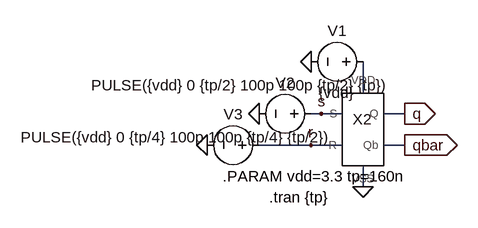
[diagram p0: schematic srlatch_tb_tran.asc]
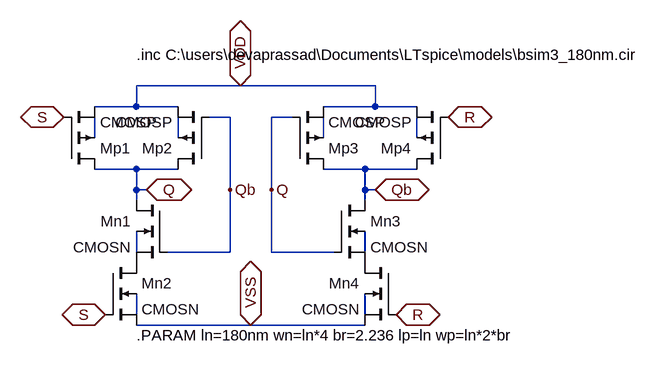
[diagram p1: sub-circuit srlatch.asc]
srlatch_tb_tran.asc, the LTspice schematic file:
Version 4.1
SHEET 1 880 680
WIRE 192 96 192 48
WIRE 128 128 112 128
WIRE 160 128 128 128
WIRE 256 128 224 128
WIRE 112 176 32 176
WIRE 160 176 112 176
WIRE 256 176 224 176
WIRE 192 240 192 208
FLAG 192 240 0
FLAG 256 176 qbar
IOPIN 256 176 Out
FLAG 256 128 q
IOPIN 256 128 Out
FLAG 112 48 0
FLAG 32 128 0
FLAG -48 176 0
FLAG 112 176 r
FLAG 128 128 s
SYMBOL voltage 208 48 R90
WINDOW 0 -32 56 VBottom 2
WINDOW 3 32 56 VTop 2
WINDOW 123 0 0 Left 0
WINDOW 39 0 0 Left 0
SYMATTR InstName V1
SYMATTR Value {vdd}
SYMBOL voltage 128 128 R90
WINDOW 0 -32 56 VBottom 2
WINDOW 3 -60 123 VTop 2
WINDOW 123 0 0 Left 0
WINDOW 39 0 0 Left 0
SYMATTR InstName V2
SYMATTR Value PULSE({vdd} 0 {tp/2} 100p 100p {tp/2} {tp})
SYMBOL voltage 48 176 R90
WINDOW 0 -32 56 VBottom 2
WINDOW 3 -28 141 VTop 2
WINDOW 123 0 0 Left 0
WINDOW 39 0 0 Left 0
SYMATTR InstName V3
SYMATTR Value PULSE({vdd} 0 {tp/4} 100p 100p {tp/4} {tp/2})
SYMBOL diglib\\latch1x\\srlatch 176 160 R0
SYMATTR InstName X2
TEXT 48 256 Left 2 !.tran {tp}
TEXT -24 224 Left 2 !.PARAM vdd=3.3 tp=160n

srlatch.asc, the sub-circuit schematic file:
Version 4.1
SHEET 1 880 680
WIRE 272 16 112 16
WIRE 480 16 272 16
WIRE 112 48 112 16
WIRE 112 48 48 48
WIRE 176 48 112 48
WIRE 480 48 480 16
WIRE 480 48 400 48
WIRE 544 48 480 48
WIRE 256 64 224 64
WIRE 352 64 320 64
WIRE 48 96 48 64
WIRE 176 96 176 64
WIRE 400 96 400 64
WIRE 544 96 544 64
WIRE 112 144 48 144
WIRE 176 144 112 144
WIRE 464 144 400 144
WIRE 544 144 464 144
WIRE 112 176 112 144
WIRE 128 176 112 176
WIRE 256 176 256 64
WIRE 320 176 320 64
WIRE 464 176 464 144
WIRE 480 176 464 176
WIRE 112 192 112 176
WIRE 464 192 464 176
WIRE 112 272 112 240
WIRE 256 272 256 176
WIRE 256 272 160 272
WIRE 320 272 320 176
WIRE 416 272 320 272
WIRE 464 272 464 240
WIRE 112 368 112 336
WIRE 464 368 464 336
WIRE 288 384 112 384
WIRE 464 384 288 384
FLAG 64 368 S
IOPIN 64 368 BiDir
FLAG 0 64 S
IOPIN 0 64 BiDir
FLAG 592 64 R
IOPIN 592 64 BiDir
FLAG 512 368 R
IOPIN 512 368 BiDir
FLAG 128 176 Q
IOPIN 128 176 BiDir
FLAG 480 176 Qb
IOPIN 480 176 BiDir
FLAG 288 384 VSS
IOPIN 288 384 BiDir
FLAG 272 16 VDD
IOPIN 272 16 BiDir
FLAG 256 176 Qb
FLAG 320 176 Q
SYMBOL pmos4 0 144 M180
SYMATTR InstName Mp1
SYMATTR Value CMOSP
SYMATTR Value2 l={lp} w={wp} ad={lp*wp} as={lp*wp} pd={2*lp+wp} ps={2*lp+wp}
SYMBOL pmos4 224 144 R180
SYMATTR InstName Mp2
SYMATTR Value CMOSP
SYMATTR Value2 l={lp} w={wp} ad={lp*wp} as={lp*wp} pd={2*lp+wp} ps={2*lp+wp}
SYMBOL pmos4 352 144 M180
SYMATTR InstName Mp3
SYMATTR Value CMOSP
SYMATTR Value2 l={lp} w={wp} ad={lp*wp} as={lp*wp} pd={2*lp+wp} ps={2*lp+wp}
SYMBOL pmos4 592 144 R180
SYMATTR InstName Mp4
SYMATTR Value CMOSP
SYMATTR Value2 l={lp} w={wp} ad={lp*wp} as={lp*wp} pd={2*lp+wp} ps={2*lp+wp}
SYMBOL nmos4 160 192 M0
SYMATTR InstName Mn1
SYMATTR Value CMOSN
SYMATTR Value2 l={ln} w={wn} ad={ln*wn} as={ln*wn} pd={2*ln+wn} ps={2*ln+wn}
SYMBOL nmos4 64 288 R0
SYMATTR InstName Mn2
SYMATTR Value CMOSN
SYMATTR Value2 l={ln} w={wn} ad={ln*wn} as={ln*wn} pd={2*ln+wn} ps={2*ln+wn}
SYMBOL nmos4 416 192 R0
SYMATTR InstName Mn3
SYMATTR Value CMOSN
SYMATTR Value2 l={ln} w={wn} ad={ln*wn} as={ln*wn} pd={2*ln+wn} ps={2*ln+wn}
SYMBOL nmos4 512 288 M0
SYMATTR InstName Mn4
SYMATTR Value CMOSN
SYMATTR Value2 l={ln} w={wn} ad={ln*wn} as={ln*wn} pd={2*ln+wn} ps={2*ln+wn}
TEXT 112 -32 Left 2 !.inc C:\\users\\devaprassad\\Documents\\LTspice\\models\\bsim3_180nm.cir
TEXT 112 400 Left 2 !.PARAM ln=180nm wn=ln*4 br=2.236 lp=ln wp=ln*2*br

The netlist it stands for:
* srlatch_tb_tran.asc
V1 N001 0 {vdd}
V2 s 0 PULSE({vdd} 0 {tp/2} 100p 100p {tp/2} {tp})
V3 r 0 PULSE({vdd} 0 {tp/4} 100p 100p {tp/4} {tp/2})
X§X2 q qbar r s N001 0 srlatch

* block symbol definitions
.subckt srlatch Q Qb R S VDD VSS
Mp1 Q S VDD N001 CMOSP l={lp} w={wp} ad={lp*wp} as={lp*wp} pd={2*lp+wp} ps={2*lp+wp}
Mp2 Q Qb VDD N002 CMOSP l={lp} w={wp} ad={lp*wp} as={lp*wp} pd={2*lp+wp} ps={2*lp+wp}
Mp3 Qb Q VDD N003 CMOSP l={lp} w={wp} ad={lp*wp} as={lp*wp} pd={2*lp+wp} ps={2*lp+wp}
Mp4 Qb R VDD N004 CMOSP l={lp} w={wp} ad={lp*wp} as={lp*wp} pd={2*lp+wp} ps={2*lp+wp}
Mn1 Q Qb P001 N005 CMOSN l={ln} w={wn} ad={ln*wn} as={ln*wn} pd={2*ln+wn} ps={2*ln+wn}
Mn2 P001 S VSS N007 CMOSN l={ln} w={wn} ad={ln*wn} as={ln*wn} pd={2*ln+wn} ps={2*ln+wn}
Mn3 Qb Q P002 N006 CMOSN l={ln} w={wn} ad={ln*wn} as={ln*wn} pd={2*ln+wn} ps={2*ln+wn}
Mn4 P002 R VSS N008 CMOSN l={ln} w={wn} ad={ln*wn} as={ln*wn} pd={2*ln+wn} ps={2*ln+wn}
.inc C:\users\devaprassad\Documents\LTspice\models\bsim3_180nm.cir
.PARAM ln=180nm wn=ln*4 br=2.236 lp=ln wp=ln*2*br
.ends srlatch

.model NMOS NMOS
.model PMOS PMOS
.lib standard.mos
.tran {tp}
.PARAM vdd=3.3 tp=160n
.backanno
.end